# Altium schematic sheet [01] - COVER PAGE.SchDoc
size A2; DocumentNumber: 1; SheetNumber: 1; SheetTotal: 10; VariantName: ORIGIN
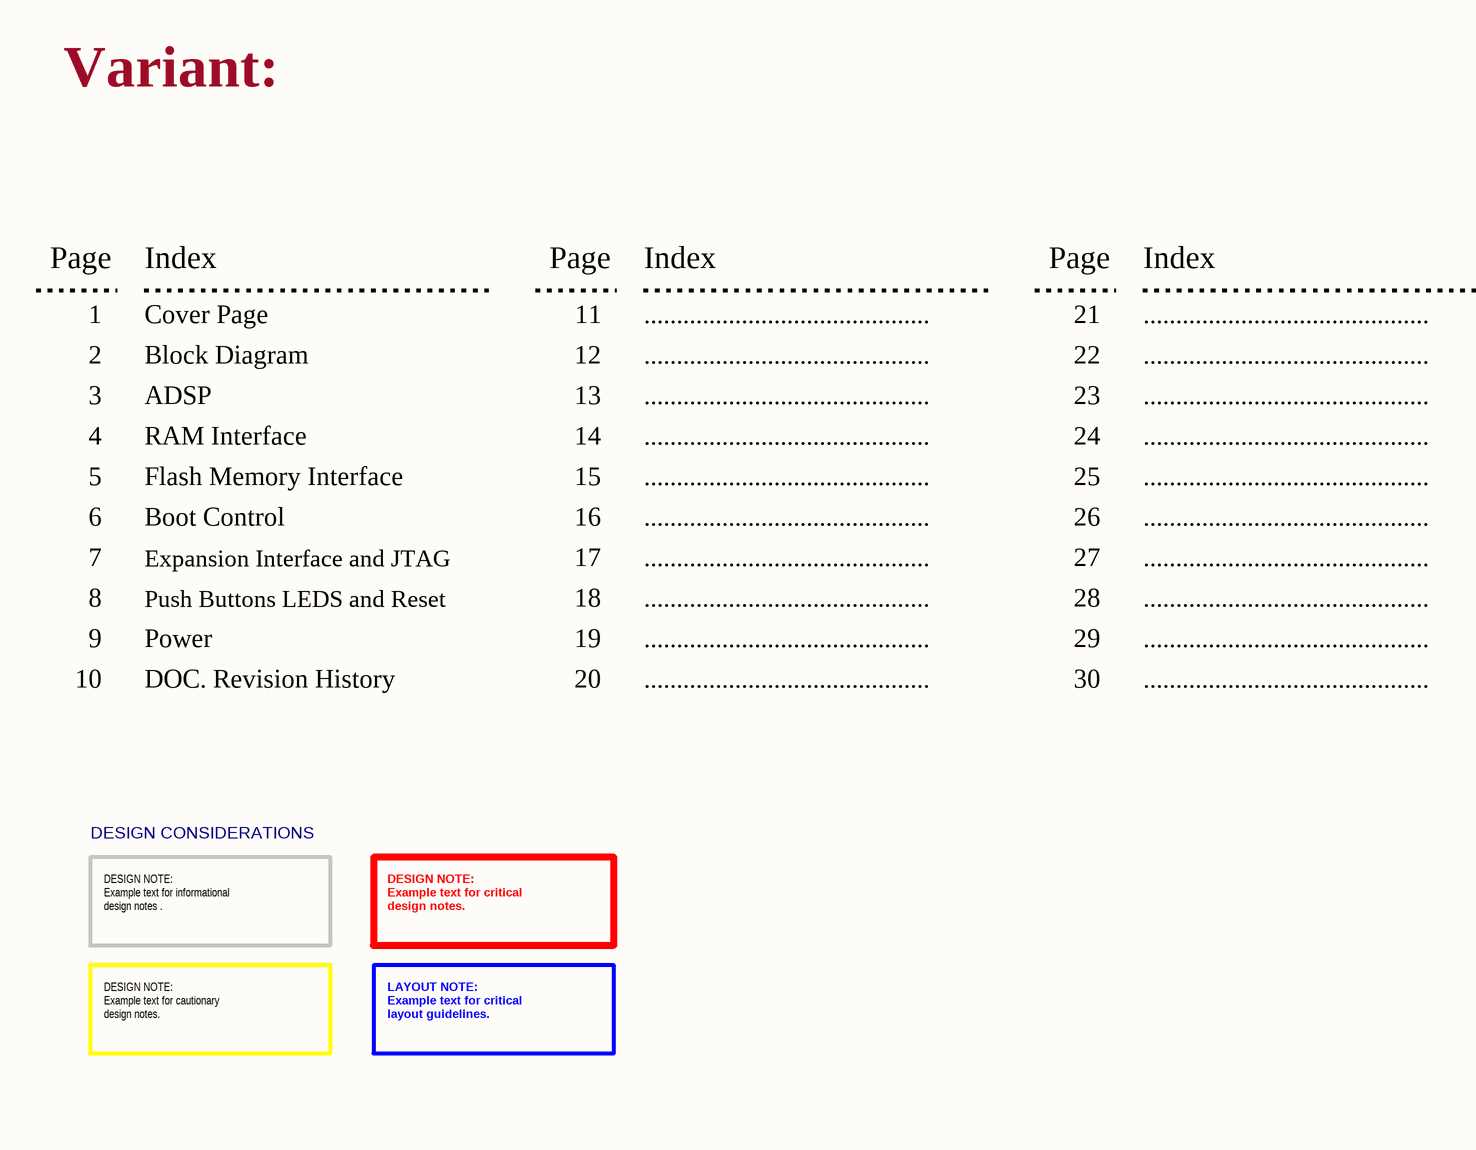
[diagram p0: [01] - COVER PAGE.SchDoc, left]
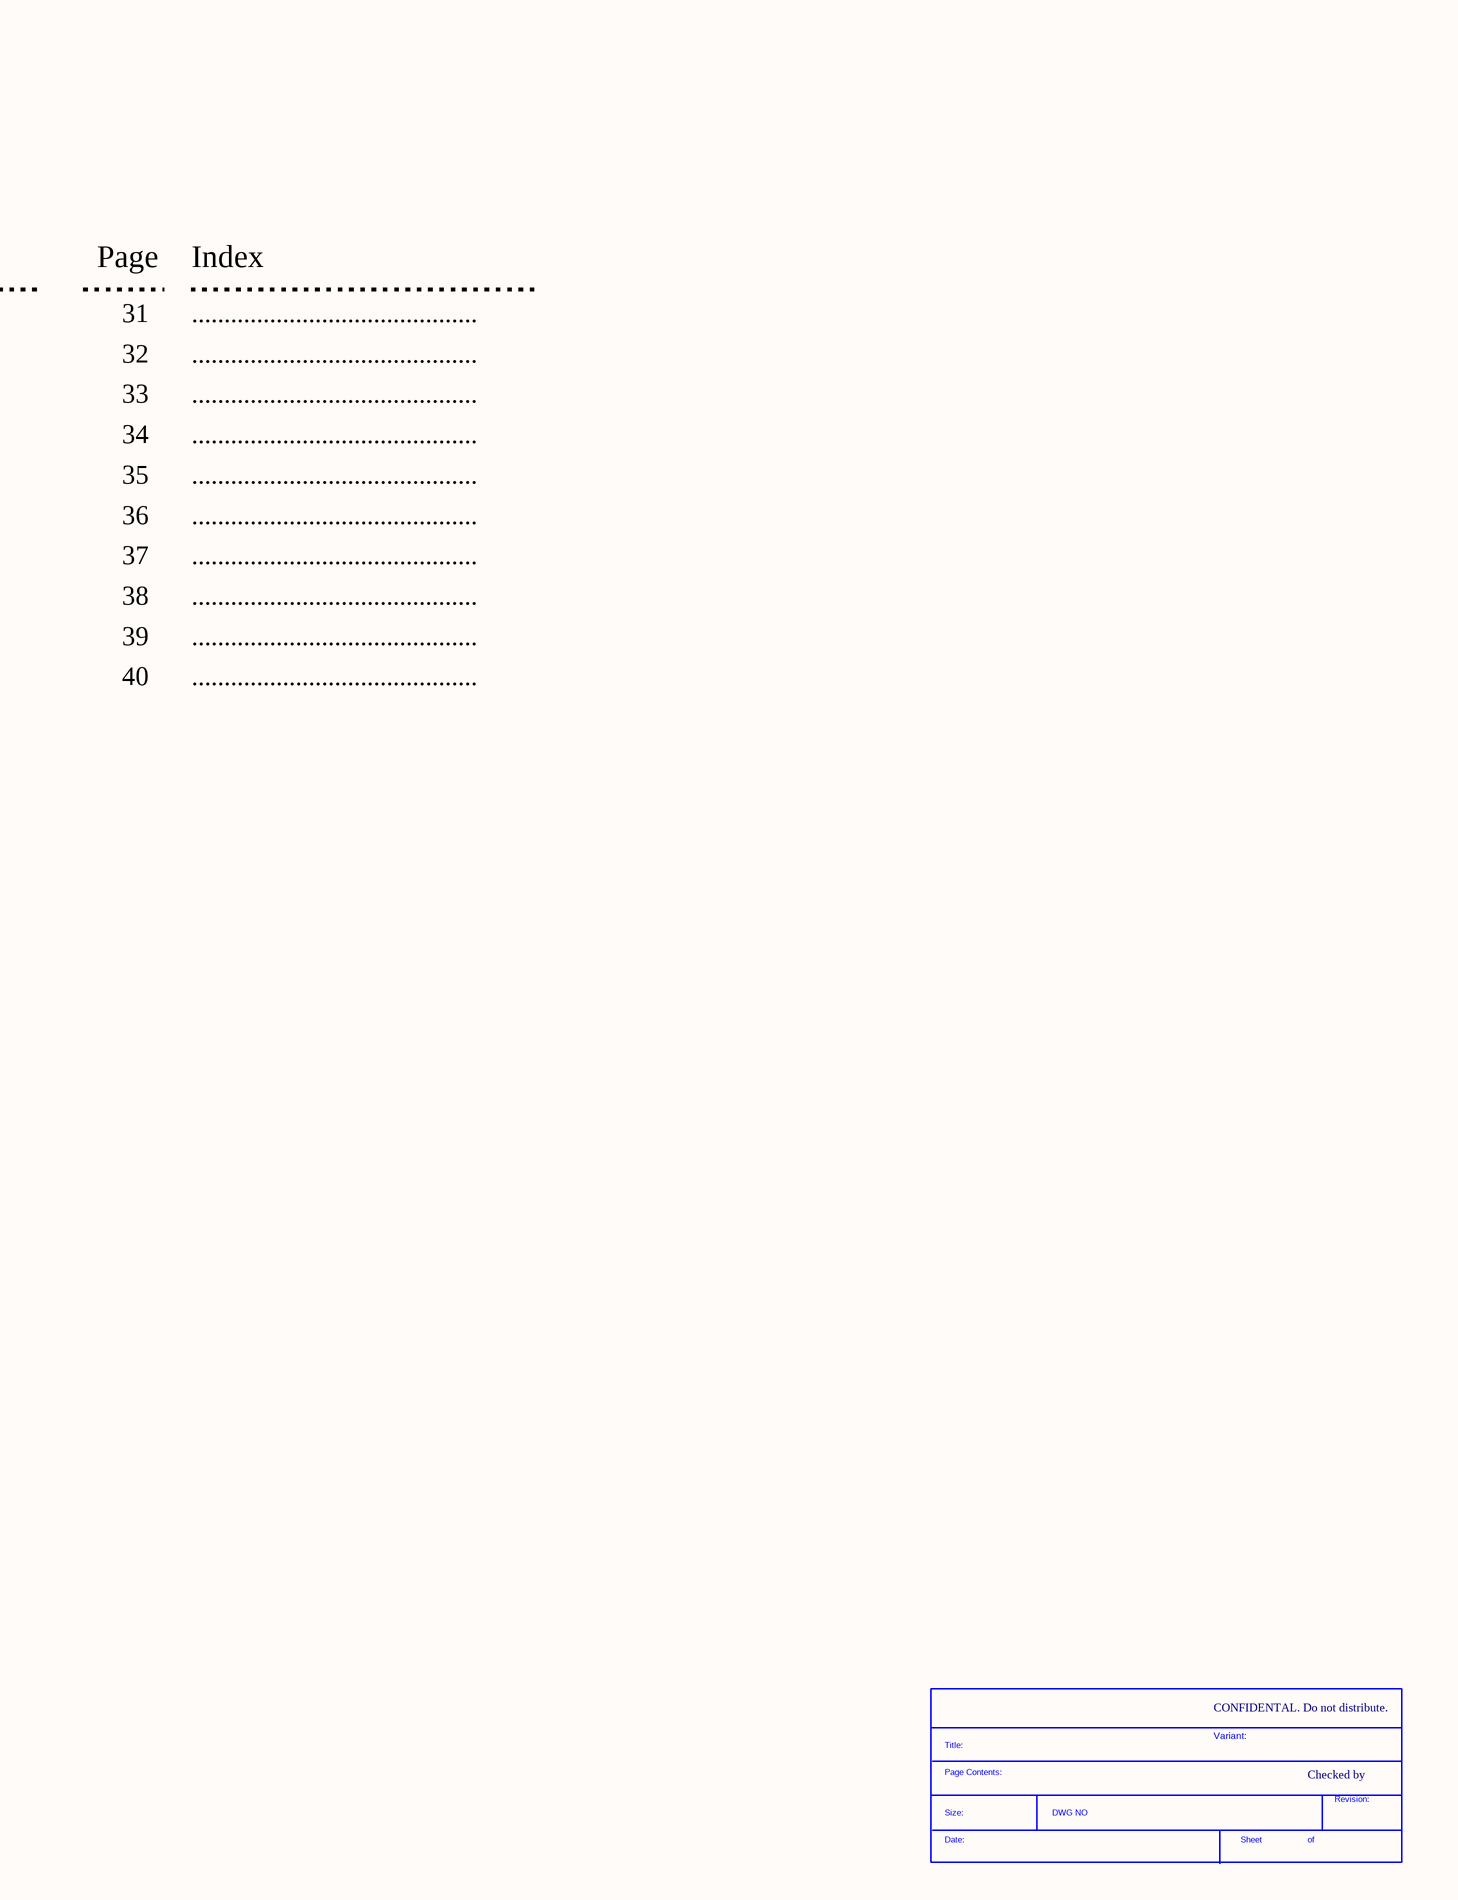
[diagram p1: [01] - COVER PAGE.SchDoc, right]

## Parts
*  SDTitleBlock  (value not drawn)  (graphical)

## Notes on the sheet
- Variant:
- Page
- Index
- 1
- 2
- Cover Page
- Block Diagram
- 11
- 12
- ............................................
- 21
- 22
- 31
- 32
- 3
- 4
- ADSP
- RAM Interface
- 13
- 14
- 23
- 24
- 33
- 34
- 5
- Flash Memory Interface
- 15
- 25
- 35
- 6
- 7
- Boot Control
- Expansion Interface and JTAG
- 16
- 17
- 26
- 27
- 36
- 37
- 8
- 9
- Push Buttons LEDS and Reset
- Power
- 18
- 19
- 28
- 29
- 38
- 39
- 10
- DOC. Revision History
- 20
- 30
- 40
- DESIGN CONSIDERATIONS
- DESIGN NOTE:
  Example text for informational
  design notes .
- DESIGN NOTE:
  Example text for critical
  design notes.
- DESIGN NOTE:
  Example text for cautionary
  design notes.
- LAYOUT NOTE:
  Example text for critical
  layout guidelines.
- CONFIDENTAL. Do not distribute.
- Checked by
- (in symbol SDTitleBlock) Title:; Page Contents:; Revision:; Size:; DWG NO; Date:; Sheet; of